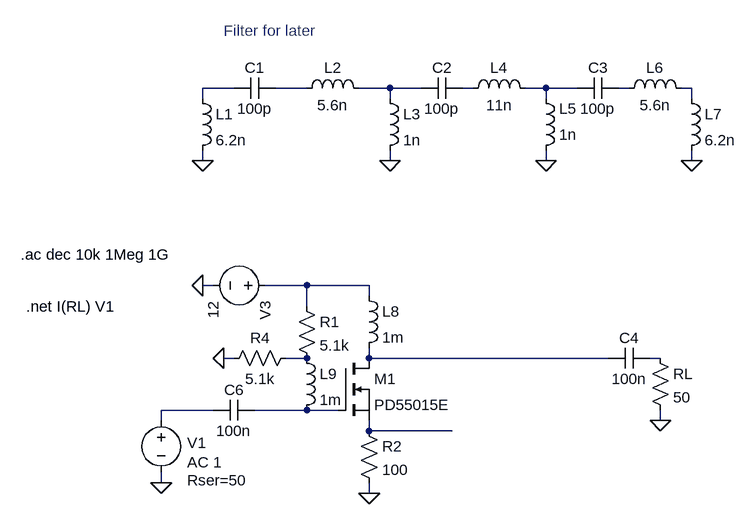
[diagram p0: schematic 2m_vhf_power_amp.asc]
2m_vhf_power_amp.asc, the LTspice schematic file:
Version 4.1
SHEET 1 1216 680
WIRE -64 -400 -112 -400
WIRE 48 -400 0 -400
WIRE 176 -400 128 -400
WIRE 224 -400 176 -400
WIRE 304 -400 288 -400
WIRE 416 -400 384 -400
WIRE 464 -400 416 -400
WIRE 544 -400 528 -400
WIRE 640 -400 624 -400
WIRE -112 -384 -112 -400
WIRE 176 -384 176 -400
WIRE 416 -384 416 -400
WIRE 640 -384 640 -400
WIRE -112 -288 -112 -304
WIRE 176 -288 176 -304
WIRE 416 -288 416 -304
WIRE 640 -288 640 -304
WIRE -96 -96 -112 -96
WIRE 48 -96 -16 -96
WIRE 144 -96 48 -96
WIRE 144 -80 144 -96
WIRE 48 -64 48 -96
WIRE -64 16 -80 16
WIRE 48 16 16 16
WIRE 144 16 144 0
WIRE 512 16 144 16
WIRE 592 16 576 16
WIRE -96 96 -176 96
WIRE 48 96 -32 96
WIRE 96 96 48 96
WIRE -176 112 -176 96
WIRE 592 112 592 96
WIRE 144 128 144 112
WIRE 272 128 144 128
WIRE -176 208 -176 192
WIRE 144 224 144 208
FLAG -112 -288 0
FLAG 176 -288 0
FLAG 416 -288 0
FLAG 640 -288 0
FLAG -176 208 0
FLAG -112 -96 0
FLAG 144 224 0
FLAG 592 112 0
FLAG -80 16 0
DATAFLAG 352 16 ""
DATAFLAG 240 128 ""
SYMBOL ind -128 -400 R0
SYMATTR InstName L1
SYMATTR Value 6.2n
SYMBOL cap 0 -416 R90
WINDOW 0 0 32 VBottom 2
WINDOW 3 32 32 VTop 2
SYMATTR InstName C1
SYMATTR Value 100p
SYMBOL ind 32 -384 R270
WINDOW 0 32 56 VTop 2
WINDOW 3 5 56 VBottom 2
SYMATTR InstName L2
SYMATTR Value 5.6n
SYMBOL ind 160 -400 R0
SYMATTR InstName L3
SYMATTR Value 1n
SYMBOL cap 288 -416 R90
WINDOW 0 0 32 VBottom 2
WINDOW 3 32 32 VTop 2
SYMATTR InstName C2
SYMATTR Value 100p
SYMBOL ind 400 -384 M270
WINDOW 0 32 56 VTop 2
WINDOW 3 5 56 VBottom 2
SYMATTR InstName L4
SYMATTR Value 11n
SYMBOL ind 400 -288 M180
WINDOW 0 36 80 Left 2
WINDOW 3 36 40 Left 2
SYMATTR InstName L5
SYMATTR Value 1n
SYMBOL cap 528 -416 R90
WINDOW 0 0 32 VBottom 2
WINDOW 3 32 32 VTop 2
SYMATTR InstName C3
SYMATTR Value 100p
SYMBOL ind 528 -384 R270
WINDOW 0 32 56 VTop 2
WINDOW 3 5 56 VBottom 2
SYMATTR InstName L6
SYMATTR Value 5.6n
SYMBOL ind 624 -400 R0
SYMATTR InstName L7
SYMATTR Value 6.2n
SYMBOL nmos 96 16 R0
SYMATTR InstName M1
SYMATTR Value PD55015E
SYMATTR Prefix X
SYMBOL voltage -176 96 R0
WINDOW 0 40 50 Left 2
WINDOW 3 40 108 Left 2
WINDOW 123 40 80 Left 2
WINDOW 39 40 108 Left 2
SYMATTR InstName V1
SYMATTR Value ""
SYMATTR Value2 AC 1
SYMATTR SpiceLine Rser=50
SYMBOL voltage 0 -96 R90
WINDOW 123 0 0 Left 0
WINDOW 39 0 0 Left 0
SYMATTR InstName V3
SYMATTR Value 12
SYMBOL res 128 112 R0
SYMATTR InstName R2
SYMATTR Value 100
SYMBOL ind 128 -96 R0
SYMATTR InstName L8
SYMATTR Value 1m
SYMBOL res 576 0 R0
SYMATTR InstName RL
SYMATTR Value 50
SYMBOL cap 576 0 R90
WINDOW 0 0 32 VBottom 2
WINDOW 3 32 32 VTop 2
SYMATTR InstName C4
SYMATTR Value 100n
SYMBOL res 32 -80 R0
SYMATTR InstName R1
SYMATTR Value 5.1k
SYMBOL res 32 0 R90
WINDOW 0 0 56 VBottom 2
WINDOW 3 32 56 VTop 2
SYMATTR InstName R4
SYMATTR Value 5.1k
SYMBOL cap -32 80 R90
WINDOW 0 0 32 VBottom 2
WINDOW 3 32 32 VTop 2
SYMATTR InstName C6
SYMATTR Value 100n
SYMBOL ind 32 0 R0
SYMATTR InstName L9
SYMATTR Value 1m
TEXT -80 -488 Left 2 ;Filter for later
TEXT -392 -144 Left 2 !.ac dec 10k 1Meg 1G
TEXT -384 -64 Left 2 !.net I(RL) V1

The netlist it stands for:
* 2m_vhf_power_amp.asc
L1 N001 0 6.2n
C1 N002 N001 100p
L2 N002 N003 5.6n
L3 N003 0 1n
C2 N004 N003 100p
L4 N005 N004 11n
L5 0 N005 1n
C3 N006 N005 100p
L6 N006 N007 5.6n
L7 N007 0 6.2n
X§M1 N010 N013 N014 PD55015E  ; pins D G S
V1 N012 0 AC 1 Rser=50
V3 N008 0 12
R2 N014 0 100
L8 N008 N010 1m
RL N011 0 50
C4 N011 N010 100n
R1 N008 N009 5.1k
R4 N009 0 5.1k
C6 N013 N012 100n
L9 N009 N013 1m
* Filter for later
.ac dec 10k 1Meg 1G
.net I(RL) V1
.backanno
.end